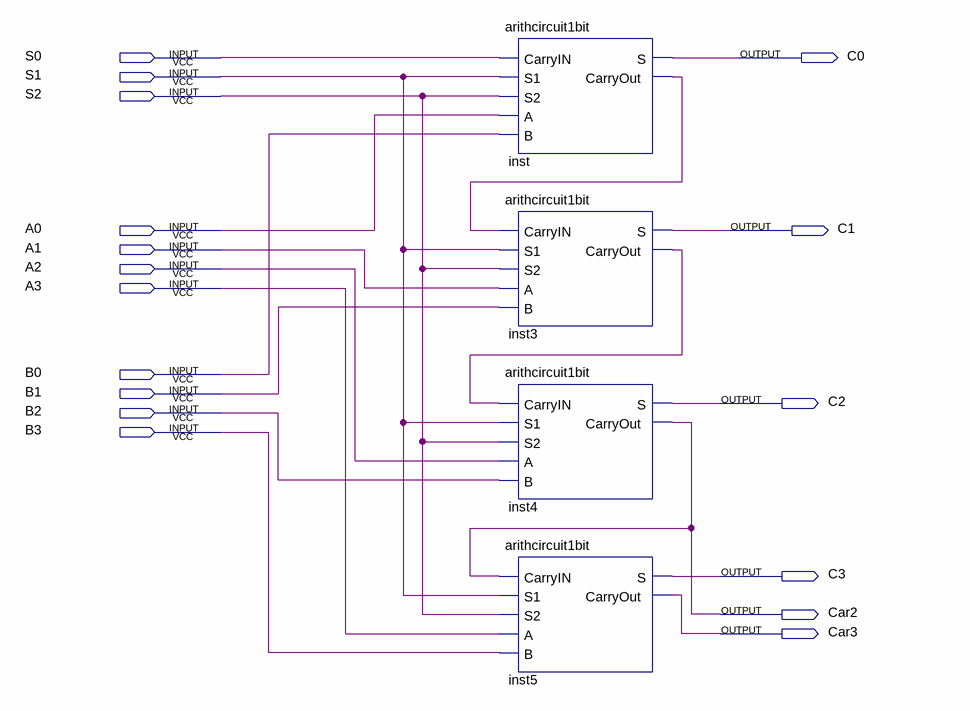
[diagram p0: schematic sheet]
// Quartus schematic arithcircuit4bit.bdf as structural Verilog: 4 symbols, 17 pins
module arithcircuit4bit (
  input  S0,
  input  S1,
  input  S2,
  input  A0,
  input  A1,
  input  A2,
  input  A3,
  input  B0,
  input  B1,
  input  B2,
  input  B3,
  output C0,
  output C1,
  output C2,
  output C3,
  output Car2,
  output Car3
);

  wire inst3_carryout, inst_carryout;

  arithcircuit1bit inst (.CarryIN(S0), .S1(S1), .S2(S2), .A(A0), .B(B0), .S(C0), .CarryOut(inst_carryout));
  arithcircuit1bit inst3 (.CarryIN(inst_carryout), .S1(S1), .S2(S2), .A(A1), .B(B1), .S(C1), .CarryOut(inst3_carryout));
  arithcircuit1bit inst4 (.CarryIN(inst3_carryout), .S1(S1), .S2(S2), .A(A2), .B(B2), .S(C2), .CarryOut(Car2));
  arithcircuit1bit inst5 (.CarryIN(Car2), .S1(S1), .S2(S2), .A(A3), .B(B3), .S(C3), .CarryOut(Car3));
endmodule
